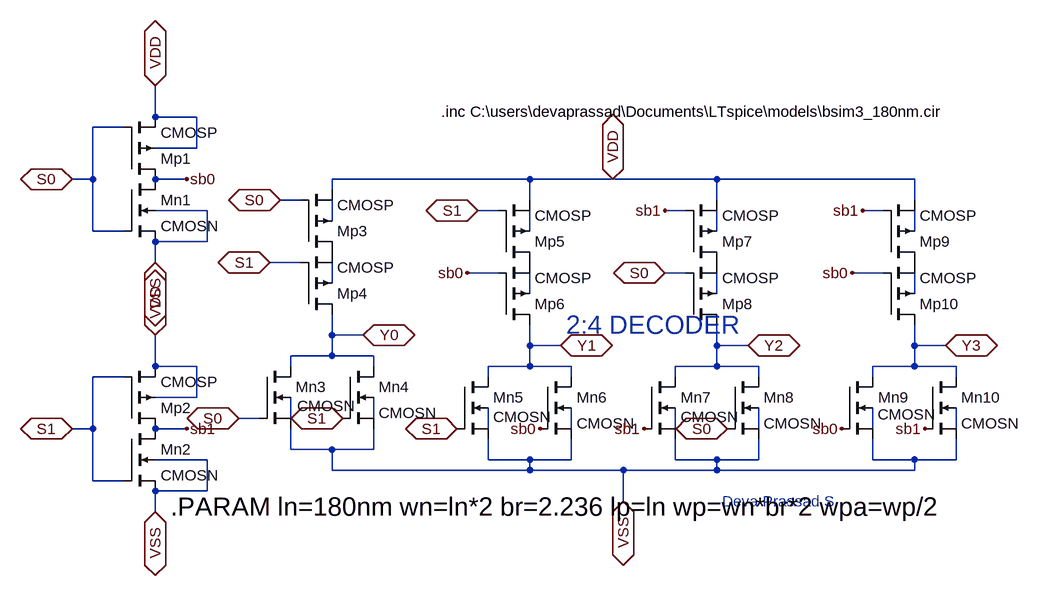
[diagram p0: schematic decoder24.asc]
decoder24.asc, the LTspice schematic file:
Version 4.1
SHEET 1 2164 800
WIRE 32 -64 32 -112
WIRE 96 -64 32 -64
WIRE -16 -48 -64 -48
WIRE 96 -16 96 -64
WIRE 96 -16 32 -16
WIRE -64 32 -64 -48
WIRE -64 32 -96 32
WIRE 80 32 32 32
WIRE 608 32 304 32
WIRE 736 32 608 32
WIRE 896 32 736 32
WIRE 1200 32 896 32
WIRE 304 48 304 32
WIRE 256 64 224 64
WIRE 608 64 608 32
WIRE 896 64 896 32
WIRE 1200 64 1200 32
WIRE 112 80 32 80
WIRE 560 80 528 80
WIRE 848 80 816 80
WIRE 1152 80 1120 80
WIRE 304 96 304 64
WIRE -64 112 -64 32
WIRE -16 112 -64 112
WIRE 608 112 608 80
WIRE 896 112 896 80
WIRE 1200 112 1200 80
WIRE 112 128 112 80
WIRE 112 128 32 128
WIRE 32 160 32 128
WIRE 256 160 208 160
WIRE 560 176 512 176
WIRE 848 176 816 176
WIRE 1152 176 1104 176
WIRE 304 192 304 160
WIRE 608 208 608 176
WIRE 896 208 896 176
WIRE 1200 208 1200 176
WIRE 304 272 304 240
WIRE 352 272 304 272
WIRE 608 288 608 256
WIRE 656 288 608 288
WIRE 896 288 896 256
WIRE 944 288 896 288
WIRE 1200 288 1200 256
WIRE 1248 288 1200 288
WIRE 304 304 304 272
WIRE 304 304 240 304
WIRE 368 304 304 304
WIRE 32 320 32 272
WIRE 96 320 32 320
WIRE 240 320 240 304
WIRE 368 320 368 304
WIRE 608 320 608 288
WIRE 608 320 544 320
WIRE 672 320 608 320
WIRE 896 320 896 288
WIRE 896 320 832 320
WIRE 960 320 896 320
WIRE 1200 320 1200 288
WIRE 1200 320 1136 320
WIRE 1264 320 1200 320
WIRE -16 336 -64 336
WIRE 544 336 544 320
WIRE 672 336 672 320
WIRE 832 336 832 320
WIRE 960 336 960 320
WIRE 1136 336 1136 320
WIRE 1264 336 1264 320
WIRE 96 368 96 320
WIRE 96 368 32 368
WIRE 192 400 160 400
WIRE 240 400 240 368
WIRE 368 400 368 368
WIRE -64 416 -64 336
WIRE -64 416 -96 416
WIRE 80 416 32 416
WIRE 544 416 544 384
WIRE 672 416 672 384
WIRE 832 416 832 384
WIRE 960 416 960 384
WIRE 1136 416 1136 384
WIRE 1264 416 1264 384
WIRE 240 448 240 416
WIRE 304 448 240 448
WIRE 368 448 368 416
WIRE 368 448 304 448
WIRE 112 464 32 464
WIRE 544 464 544 432
WIRE 608 464 544 464
WIRE 672 464 672 432
WIRE 672 464 608 464
WIRE 832 464 832 432
WIRE 896 464 832 464
WIRE 960 464 960 432
WIRE 960 464 896 464
WIRE 1136 464 1136 432
WIRE 1200 464 1136 464
WIRE 1264 464 1264 432
WIRE 1264 464 1200 464
WIRE 304 480 304 448
WIRE 608 480 608 464
WIRE 608 480 304 480
WIRE 752 480 608 480
WIRE 896 480 896 464
WIRE 896 480 752 480
WIRE 1200 480 1200 464
WIRE 1200 480 896 480
WIRE -64 496 -64 416
WIRE -16 496 -64 496
WIRE 112 512 112 464
WIRE 112 512 32 512
WIRE 752 528 752 480
WIRE 32 544 32 512
FLAG -96 32 S0
IOPIN -96 32 BiDir
FLAG 80 32 sb0
FLAG 32 -112 VDD
IOPIN 32 -112 BiDir
FLAG 32 160 VSS
IOPIN 32 160 BiDir
FLAG 224 64 S0
IOPIN 224 64 BiDir
FLAG 160 400 S0
IOPIN 160 400 BiDir
FLAG 208 160 S1
IOPIN 208 160 BiDir
FLAG 352 272 Y0
IOPIN 352 272 BiDir
FLAG 752 528 VSS
IOPIN 752 528 BiDir
FLAG 736 32 VDD
IOPIN 736 32 BiDir
FLAG 528 80 S1
IOPIN 528 80 BiDir
FLAG 512 176 sb0
FLAG 656 288 Y1
IOPIN 656 288 BiDir
FLAG 944 288 Y2
IOPIN 944 288 BiDir
FLAG 1104 176 sb0
FLAG 1248 288 Y3
IOPIN 1248 288 BiDir
FLAG -96 416 S1
IOPIN -96 416 BiDir
FLAG 80 416 sb1
FLAG 32 272 VDD
IOPIN 32 272 BiDir
FLAG 32 544 VSS
IOPIN 32 544 BiDir
FLAG 320 400 S1
IOPIN 320 400 BiDir
FLAG 1088 416 sb0
FLAG 496 416 S1
IOPIN 496 416 BiDir
FLAG 624 416 sb0
FLAG 912 416 S0
IOPIN 912 416 BiDir
FLAG 816 176 S0
IOPIN 816 176 BiDir
FLAG 784 416 sb1
FLAG 816 80 sb1
FLAG 1216 416 sb1
FLAG 1120 80 sb1
SYMBOL pmos4 256 144 M180
SYMATTR InstName Mp3
SYMATTR Value CMOSP
SYMATTR Value2 l={lp} w={wp} ad={lp*wp} as={lp*wp} pd={2*lp+wp} ps={2*lp+wp}
SYMBOL nmos4 192 320 R0
WINDOW 3 58 61 Left 2
SYMATTR Value CMOSN
SYMATTR InstName Mn3
SYMATTR Value2 l={ln} w={wn} ad={ln*wn} as={ln*wn} pd={2*ln+wn} ps={2*ln+wn}
SYMBOL pmos4 256 240 M180
SYMATTR InstName Mp4
SYMATTR Value CMOSP
SYMATTR Value2 l={lp} w={wp} ad={lp*wp} as={lp*wp} pd={2*lp+wp} ps={2*lp+wp}
SYMBOL nmos4 -16 32 R0
SYMATTR InstName Mn1
SYMATTR Value CMOSN
SYMATTR Value2 l={ln} w={wn} ad={ln*wn} as={ln*wn} pd={2*ln+wn} ps={2*ln+wn}
SYMBOL nmos4 320 320 R0
SYMATTR InstName Mn4
SYMATTR Value CMOSN
SYMATTR Value2 l={ln} w={wn} ad={ln*wn} as={ln*wn} pd={2*ln+wn} ps={2*ln+wn}
SYMBOL pmos4 560 160 M180
SYMATTR InstName Mp5
SYMATTR Value CMOSP
SYMATTR Value2 l={lp} w={wp} ad={lp*wp} as={lp*wp} pd={2*lp+wp} ps={2*lp+wp}
SYMBOL nmos4 496 336 R0
WINDOW 3 56 62 Left 2
SYMATTR Value CMOSN
SYMATTR InstName Mn5
SYMATTR Value2 l={ln} w={wn} ad={ln*wn} as={ln*wn} pd={2*ln+wn} ps={2*ln+wn}
SYMBOL pmos4 560 256 M180
SYMATTR InstName Mp6
SYMATTR Value CMOSP
SYMATTR Value2 l={lp} w={wp} ad={lp*wp} as={lp*wp} pd={2*lp+wp} ps={2*lp+wp}
SYMBOL nmos4 624 336 R0
SYMATTR InstName Mn6
SYMATTR Value CMOSN
SYMATTR Value2 l={ln} w={wn} ad={ln*wn} as={ln*wn} pd={2*ln+wn} ps={2*ln+wn}
SYMBOL pmos4 848 160 M180
SYMATTR InstName Mp7
SYMATTR Value CMOSP
SYMATTR Value2 l={lp} w={wp} ad={lp*wp} as={lp*wp} pd={2*lp+wp} ps={2*lp+wp}
SYMBOL nmos4 784 336 R0
WINDOW 3 56 62 Left 2
SYMATTR Value CMOSN
SYMATTR InstName Mn7
SYMATTR Value2 l={ln} w={wn} ad={ln*wn} as={ln*wn} pd={2*ln+wn} ps={2*ln+wn}
SYMBOL pmos4 848 256 M180
SYMATTR InstName Mp8
SYMATTR Value CMOSP
SYMATTR Value2 l={lp} w={wp} ad={lp*wp} as={lp*wp} pd={2*lp+wp} ps={2*lp+wp}
SYMBOL nmos4 912 336 R0
SYMATTR InstName Mn8
SYMATTR Value CMOSN
SYMATTR Value2 l={ln} w={wn} ad={ln*wn} as={ln*wn} pd={2*ln+wn} ps={2*ln+wn}
SYMBOL pmos4 1152 160 M180
SYMATTR InstName Mp9
SYMATTR Value CMOSP
SYMATTR Value2 l={lp} w={wp} ad={lp*wp} as={lp*wp} pd={2*lp+wp} ps={2*lp+wp}
SYMBOL nmos4 1088 336 R0
WINDOW 3 55 58 Left 2
SYMATTR Value CMOSN
SYMATTR InstName Mn9
SYMATTR Value2 l={ln} w={wn} ad={ln*wn} as={ln*wn} pd={2*ln+wn} ps={2*ln+wn}
SYMBOL pmos4 1152 256 M180
SYMATTR InstName Mp10
SYMATTR Value CMOSP
SYMATTR Value2 l={lp} w={wp} ad={lp*wp} as={lp*wp} pd={2*lp+wp} ps={2*lp+wp}
SYMBOL nmos4 1216 336 R0
SYMATTR InstName Mn10
SYMATTR Value CMOSN
SYMATTR Value2 l={ln} w={wn} ad={ln*wn} as={ln*wn} pd={2*ln+wn} ps={2*ln+wn}
SYMBOL pmos4 -16 416 M180
SYMATTR InstName Mp2
SYMATTR Value CMOSP
SYMATTR Value2 l={lp} w={wpa} ad={lp*wpa} as={lp*wpa} pd={2*lp+wpa} ps={2*lp+wpa}
SYMBOL nmos4 -16 416 R0
SYMATTR InstName Mn2
SYMATTR Value CMOSN
SYMATTR Value2 l={ln} w={wn} ad={ln*wn} as={ln*wn} pd={2*ln+wn} ps={2*ln+wn}
SYMBOL pmos4 -16 32 M180
SYMATTR InstName Mp1
SYMATTR Value CMOSP
SYMATTR Value2 l={lp} w={wpa} ad={lp*wpa} as={lp*wpa} pd={2*lp+wpa} ps={2*lp+wpa}
TEXT 904 528 Left 2 ;Deva Prassad S
TEXT 472 -72 Left 2 !.inc C:\\users\\devaprassad\\Documents\\LTspice\\models\\bsim3_180nm.cir
TEXT 56 536 Left 4 !.PARAM ln=180nm wn=ln*2 br=2.236 lp=ln wp=wn*br*2 wpa=wp/2
TEXT 664 256 Left 4 ;2:4 DECODER

The netlist it stands for:
* decoder24.asc
Mp3 P001 S0 VDD N001 CMOSP l={lp} w={wp} ad={lp*wp} as={lp*wp} pd={2*lp+wp} ps={2*lp+wp}
Mn3 Y0 S0 VSS N009 CMOSN l={ln} w={wn} ad={ln*wn} as={ln*wn} pd={2*ln+wn} ps={2*ln+wn}
Mp4 Y0 S1 P001 N005 CMOSP l={lp} w={wp} ad={lp*wp} as={lp*wp} pd={2*lp+wp} ps={2*lp+wp}
Mn1 sb0 S0 VSS VSS CMOSN l={ln} w={wn} ad={ln*wn} as={ln*wn} pd={2*ln+wn} ps={2*ln+wn}
Mn4 Y0 S1 VSS N010 CMOSN l={ln} w={wn} ad={ln*wn} as={ln*wn} pd={2*ln+wn} ps={2*ln+wn}
Mp5 P002 S1 VDD N002 CMOSP l={lp} w={wp} ad={lp*wp} as={lp*wp} pd={2*lp+wp} ps={2*lp+wp}
Mn5 Y1 S1 VSS N011 CMOSN l={ln} w={wn} ad={ln*wn} as={ln*wn} pd={2*ln+wn} ps={2*ln+wn}
Mp6 Y1 sb0 P002 N006 CMOSP l={lp} w={wp} ad={lp*wp} as={lp*wp} pd={2*lp+wp} ps={2*lp+wp}
Mn6 Y1 sb0 VSS N012 CMOSN l={ln} w={wn} ad={ln*wn} as={ln*wn} pd={2*ln+wn} ps={2*ln+wn}
Mp7 P003 sb1 VDD N003 CMOSP l={lp} w={wp} ad={lp*wp} as={lp*wp} pd={2*lp+wp} ps={2*lp+wp}
Mn7 Y2 sb1 VSS N013 CMOSN l={ln} w={wn} ad={ln*wn} as={ln*wn} pd={2*ln+wn} ps={2*ln+wn}
Mp8 Y2 S0 P003 N007 CMOSP l={lp} w={wp} ad={lp*wp} as={lp*wp} pd={2*lp+wp} ps={2*lp+wp}
Mn8 Y2 S0 VSS N014 CMOSN l={ln} w={wn} ad={ln*wn} as={ln*wn} pd={2*ln+wn} ps={2*ln+wn}
Mp9 P004 sb1 VDD N004 CMOSP l={lp} w={wp} ad={lp*wp} as={lp*wp} pd={2*lp+wp} ps={2*lp+wp}
Mn9 Y3 sb0 VSS N015 CMOSN l={ln} w={wn} ad={ln*wn} as={ln*wn} pd={2*ln+wn} ps={2*ln+wn}
Mp10 Y3 sb0 P004 N008 CMOSP l={lp} w={wp} ad={lp*wp} as={lp*wp} pd={2*lp+wp} ps={2*lp+wp}
Mn10 Y3 sb1 VSS N016 CMOSN l={ln} w={wn} ad={ln*wn} as={ln*wn} pd={2*ln+wn} ps={2*ln+wn}
Mp2 sb1 S1 VDD VDD CMOSP l={lp} w={wpa} ad={lp*wpa} as={lp*wpa} pd={2*lp+wpa} ps={2*lp+wpa}
Mn2 sb1 S1 VSS VSS CMOSN l={ln} w={wn} ad={ln*wn} as={ln*wn} pd={2*ln+wn} ps={2*ln+wn}
Mp1 sb0 S0 VDD VDD CMOSP l={lp} w={wpa} ad={lp*wpa} as={lp*wpa} pd={2*lp+wpa} ps={2*lp+wpa}
.model NMOS NMOS
.model PMOS PMOS
.lib standard.mos
* Deva Prassad S
.inc C:\users\devaprassad\Documents\LTspice\models\bsim3_180nm.cir
.PARAM ln=180nm wn=ln*2 br=2.236 lp=ln wp=wn*br*2 wpa=wp/2
* 2:4 DECODER
.backanno
.end